# Altium schematic sheet 04-ICs.SchDoc: ICs
size A; Revision: A; SheetNumber: 3; SheetTotal: 3; ECE315_Project_Name: ECE453 F24
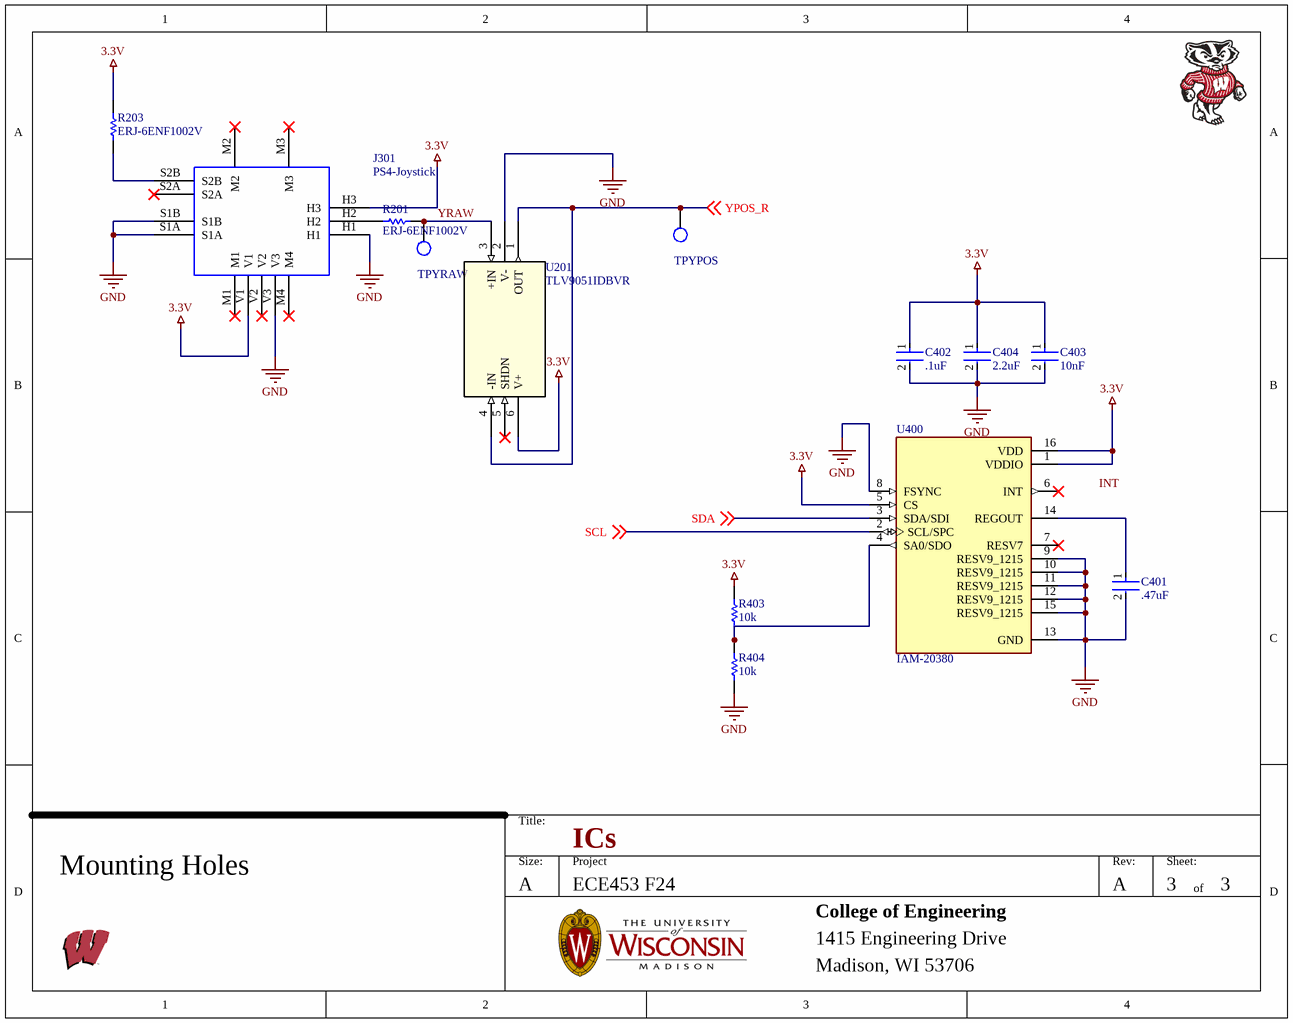
[diagram p0: 04-ICs.SchDoc]

## Parts
C401  .47uF  [FP-C0805C-DN-MFG]
C402  .1uF  [FP-C0805C-DN-MFG]
C403  10nF  [FP-C0805C-DN-MFG]
C404  2.2uF  [FP-C0805C-DN-MFG]
J301  PS4-Joystick  [PS4-Joystick]
R201  ERJ-6ENF1002V  [RESC2013X70X40ML20T20]
R203  ERJ-6ENF1002V  [RESC2013X70X40ML20T20]
R403  10k  [RESC2013X70X40ML20T20]
R404  10k  [RESC2013X70X40ML20T20]
TPYPOS  YRAW  [FP-5019-MFG]  (value not drawn)
TPYRAW  YRAW  [FP-5019-MFG]  (value not drawn)
U201  TLV9051IDBVR  [SOT23_DBV_TEX]
U400  IAM-20380  [PQFN50P300X300X80-16N]

## Nets
3.3V: C402.1 C403.1 C404.1 J301.H3 J301.V1 R203.2 R403.2 U201.6(V+) U400.1(VDDIO) U400.5(CS) U400.16(VDD)
GND: C401.2 C402.2 C403.2 C404.2 J301.H1 J301.S1A J301.S1B J301.V3 R404.1 U201.2(V-) U400.8(FSYNC) U400.9(RESV9_1215) U400.10(RESV9_1215) U400.11(RESV9_1215) U400.12(RESV9_1215) U400.13(GND) U400.15(RESV9_1215)
SCL: U400.2(SCL/SPC) ; off-sheet SCL
SDA: U400.3(SDA/SDI) ; off-sheet SDA
YPOS_R: TPYPOS.1 U201.1(OUT) U201.4(-IN) ; off-sheet YPOS_R
YRAW: R201.1 TPYRAW.1 U201.3(+IN)
NetC401_1: C401.1 U400.14(REGOUT)
NetJ301_H2: J301.H2 R201.2
NetJ301_S2B: J301.S2B R203.1
NetR403_1: R403.1 R404.2 U400.4(SA0/SDO)

Not connected (* = marked no-connect by the designer): J301 M1* M2* M3* M4* S2A* V2*; U201 5(SHDN)*; U400 6(INT)* 7(RESV7)*

## Notes on the sheet
- Mounting Holes
- Labels drawn without touching a wire or pin: INT
- Title:
- Size:
- A
- Project
- Rev:
- Sheet:
- of
- College of Engineering
- 1415 Engineering Drive
- Madison, WI 53706

## Library data of the parts
C401 C403 C404 = CMP-2007-01081-3: CAP CER SMD 0805 .01UF 100V X7R; Manufacturer Part Number: C0805C103K1RAC7210; Manufacturer: KEMET; Capacitance: 10,000 pF; Material: Ceramic; Value: 10,000 pF; Tolerance: 0.1; Temperature Coefficient: 30ppm/°C; Voltage Rating: 100 V; Octopart: https://octopart.com/c0805c103k1rac7210-kemet-3919887; Digikey Description: CAP CER SMD 0805 .01UF 100V X7R; Temperature: -55°C to +125°C; Mouser Description: Multilayer Ceramic Capacitors MLCC - SMD/SMT 100volts 10000pF X7R 10%; Device Class L2: Capacitors; Device Class L1: Passive Components; Ipc Land Pattern Name: CAPC200125X78; Height: 0.88mm; Device Class L3: Ceramic Capacitors; RoHS: TRUE; Package: C0805C-DN; Temperature Characteristic: X7R; Automotive: No; Lead Free: Yes; Category: Cap; Temperature Range High: +125°C; ComponentLink2Description: Datasheet; Temperature Range Low: -55°C; ComponentLink2URL: https://content.kemet.com/datasheets/KEM_C1003_C0G_SMD.pdf
C402 = CMP-2007-00279-2: CAP CER 0.1UF 50V X7R 0805; Manufacturer Part Number: C0805C104K5RACTU; Manufacturer: KEMET; Value: 0.10 μF; Tolerance: 0.1; Temperature Coefficient: 30ppm/°C; Material: Ceramic; Device Class L2: Capacitors; Temperature Range Low: -55°C; Voltage Rating: 50 V; Digikey Description: CAP CER 0.1UF 50V X7R 0805; Category: Cap; ComponentLink2Description: Datasheet; Octopart: https://octopart.com/c0805c104k5ractu-kemet-143926; RoHS: TRUE; ComponentLink2URL: https://content.kemet.com/datasheets/KEM_C1003_C0G_SMD.pdf; Temperature Characteristic: X7R; Temperature: -55°C to +125°C; Height: 0.88mm; Temperature Range High: +125°C; Device Class L1: Passive Components; Automotive: No; Lead Free: Yes; Ipc Land Pattern Name: CAPC200125X78; Device Class L3: Ceramic Capacitors; Mouser Description: Cap Ceramic 0.1uF 50V X7R 10% SMD 2.0 x 1.2 mm 125 C Paper T/R; Capacitance: 0.10 μF; Package: C0805C-DN
R201 R203 = CMP-2001-04376-1: Manufacturer: Panasonic; Part Number: ERJ-6ENF1002V
R403 R404 = CMP-2001-04376-1: Manufacturer: Panasonic; Part Number: ERJ-6ENF1002V
TPYPOS TPYRAW = TP_5019: Test Point, Mini, SMT, Phos Bronze/Silver, 1000pc Tape & Reel | Keystone Electronics 5019; Manufacturer Part Number: 5019; Plating: Silver; Body Material: Bronze; Number of Contacts: 1NUMBER; Supplier 1: Digikey; Supplier Part Number 1: 36-5019CT-ND; Manufacturer: Keystone Electronics; RoHS: Yes; Category: Terminals; Stock: 282853; Pricing: 1=0.37, 25=0.2496, 100=0.2117, 250=0.1902, 500=0.1756, 1000=0.16229, 2000=0.15019, 3000=0.14362, 5000=0.13585, 7000=0.13102, 10000=0.12613, 25000=0.1211 (USD); Mounting Technology: Surface Mount,PCB; Pins: 1; Contact Plating: Silver; Contact Material: Bronze; Material: Bronze; Packaging: Tape and Reel; Package Quantity: 1; Termination: SMD/SMT; Series: 5019; Height: 0.09inch; Reach SVHC Compliant: No; RoHS Compliant: Yes; Lead Free: Lead Free; ComponentLink1URL: https://datasheet.ciiva.com/14848/m60-2p61-14848437.pdf?src-supplier=Digikey; ComponentLink1Description: https://datasheet.ciiva.com/14848/m60-2p61-14848437.pdf?src-supplier=Digikey; ComponentLink2URL: https://datasheet.ciiva.com/14848/m60-2p61-14848438.pdf?src-supplier=Digikey; ComponentLink2Description: https://datasheet.ciiva.com/14848/m60-2p61-14848438.pdf?src-supplier=Digikey; ComponentLink3URL: https://datasheet.ciiva.com/14848/m60-2p61-14848439.pdf?src-supplier=Digikey; ComponentLink3Description: https://datasheet.ciiva.com/14848/m60-2p61-14848439.pdf?src-supplier=Digikey; ComponentLink4URL: https://datasheet.ciiva.com/16885/70182998-16885945.pdf?src-supplier=Allied+Electronics; ComponentLink4Description: https://datasheet.ciiva.com/16885/70182998-16885945.pdf?src-supplier=Allied+Electronics; ComponentLink5URL: https://datasheet.ciiva.com/16318/m60-2p61-16318395.pdf?src-supplier=Future+Electronics; ComponentLink5Description: https://datasheet.ciiva.com/16318/m60-2p61-16318395.pdf?src-supplier=Future+Electronics
U201 = TLV9051IDBVR: Single 5-MHz, 15-V/µs high slew-rate, RRIO op amp 5-SOT-23 -40 to 125; Mfr_Name: Texas Instruments; RefDes: RefDes; Type: Type; Supplier: Mouser; Supplier Part Number: 595-TLV9051IDBVR; Manufacturer: Texas Instruments; Manufacturer Part Number: TLV9051IDBVR; RoHS: Yes; Category: Amplifiers - Op Amps, Buffer, Instrumentation; Stock: 3599; Pricing: 1=0.47, 10=0.294, 50=0.294, 100=0.237, 1000=0.216, 10000=0.191 (USD)
U400 = IAM-20380: Gyroscope X _Pitch_, Y _Roll_, Z _Yaw_ Â±250, 500, 1000, 2000 27kHz IÂ²C, SPI 16-LGA _3x3_; MF: TDK InvenSense; Value: *; SnapEDA_Link: https://www.snapeda.com/parts/IAM-20380/TDK%20InvenSense/view-part/2757130/?ref=snap; Package: PQFN-16 TDK-InvenSense; MP: IAM-20380; Price: None; Availability: Unavailable